# Altium schematic sheet TaskAltium.SchDoc
size A4; SheetNumber: 1; SheetTotal: 1
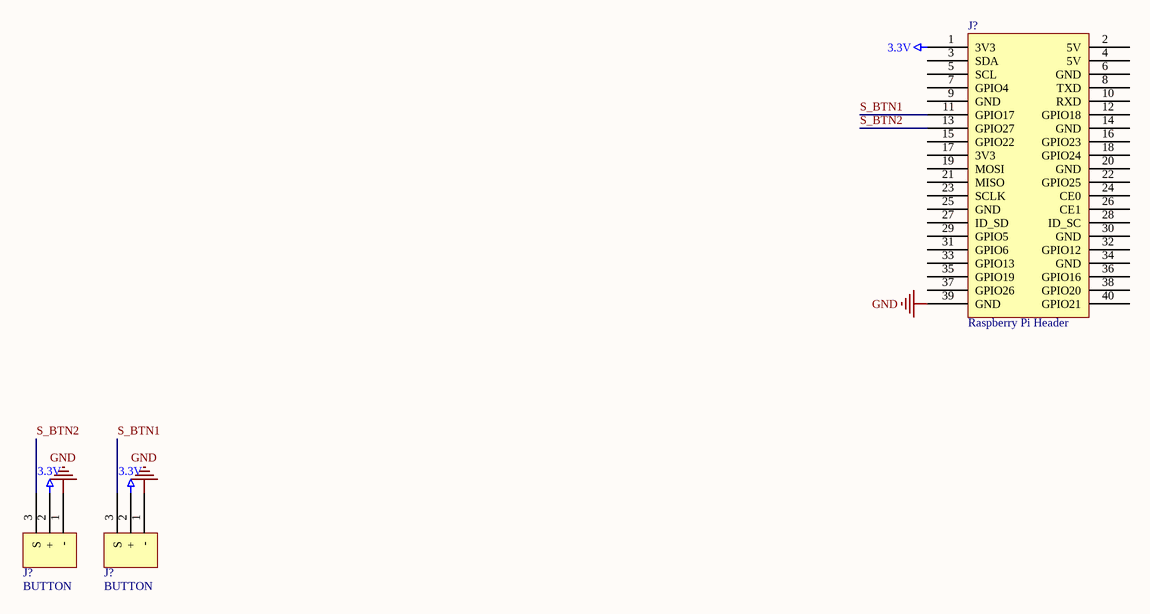
[diagram p0: TaskAltium.SchDoc]

## Parts
(Parts that share a designator on the sheet are numbered #1, #2 ... from top to bottom, then left to right.)
J?#1  Raspberry Pi Header  [HDR_2x20_2.54]
J?#2  BUTTON  [HDR_1X3]
J?#3  BUTTON  [HDR_1X3]

## Nets
3.3V: J?#1.1(3V3) J?#2.2(+) J?#3.2(+)
GND: J?#1.39(GND) J?#2.1(-) J?#3.1(-)
S_BTN1: J?#1.11(GPIO17) J?#3.3(S)
S_BTN2: J?#1.13(GPIO27) J?#2.3(S)

Not connected (* = marked no-connect by the designer): J?#1 2(5V) 3(SDA) 4(5V) 5(SCL) 6(GND) 7(GPIO4) 8(TXD) 9(GND) 10(RXD) 12(GPIO18) 14(GND) 15(GPIO22) 16(GPIO23) 17(3V3) 18(GPIO24) 19(MOSI) 20(GND) 21(MISO) 22(GPIO25) 23(SCLK) 24(CE0) 25(GND) 26(CE1) 27(ID_SD) 28(ID_SC) 29(GPIO5) 30(GND) 31(GPIO6) 32(GPIO12) 33(GPIO13) 34(GND) 35(GPIO19) 36(GPIO16) 37(GPIO26) 38(GPIO20) 40(GPIO21)

## Library data of the parts
J?#1 = RPI_HDR_2x20